# Altium schematic sheet Power-Sheet.SchDoc (part 1 of 2)
size 420 x 297 mm; SheetNumber: 2; SheetTotal: 3
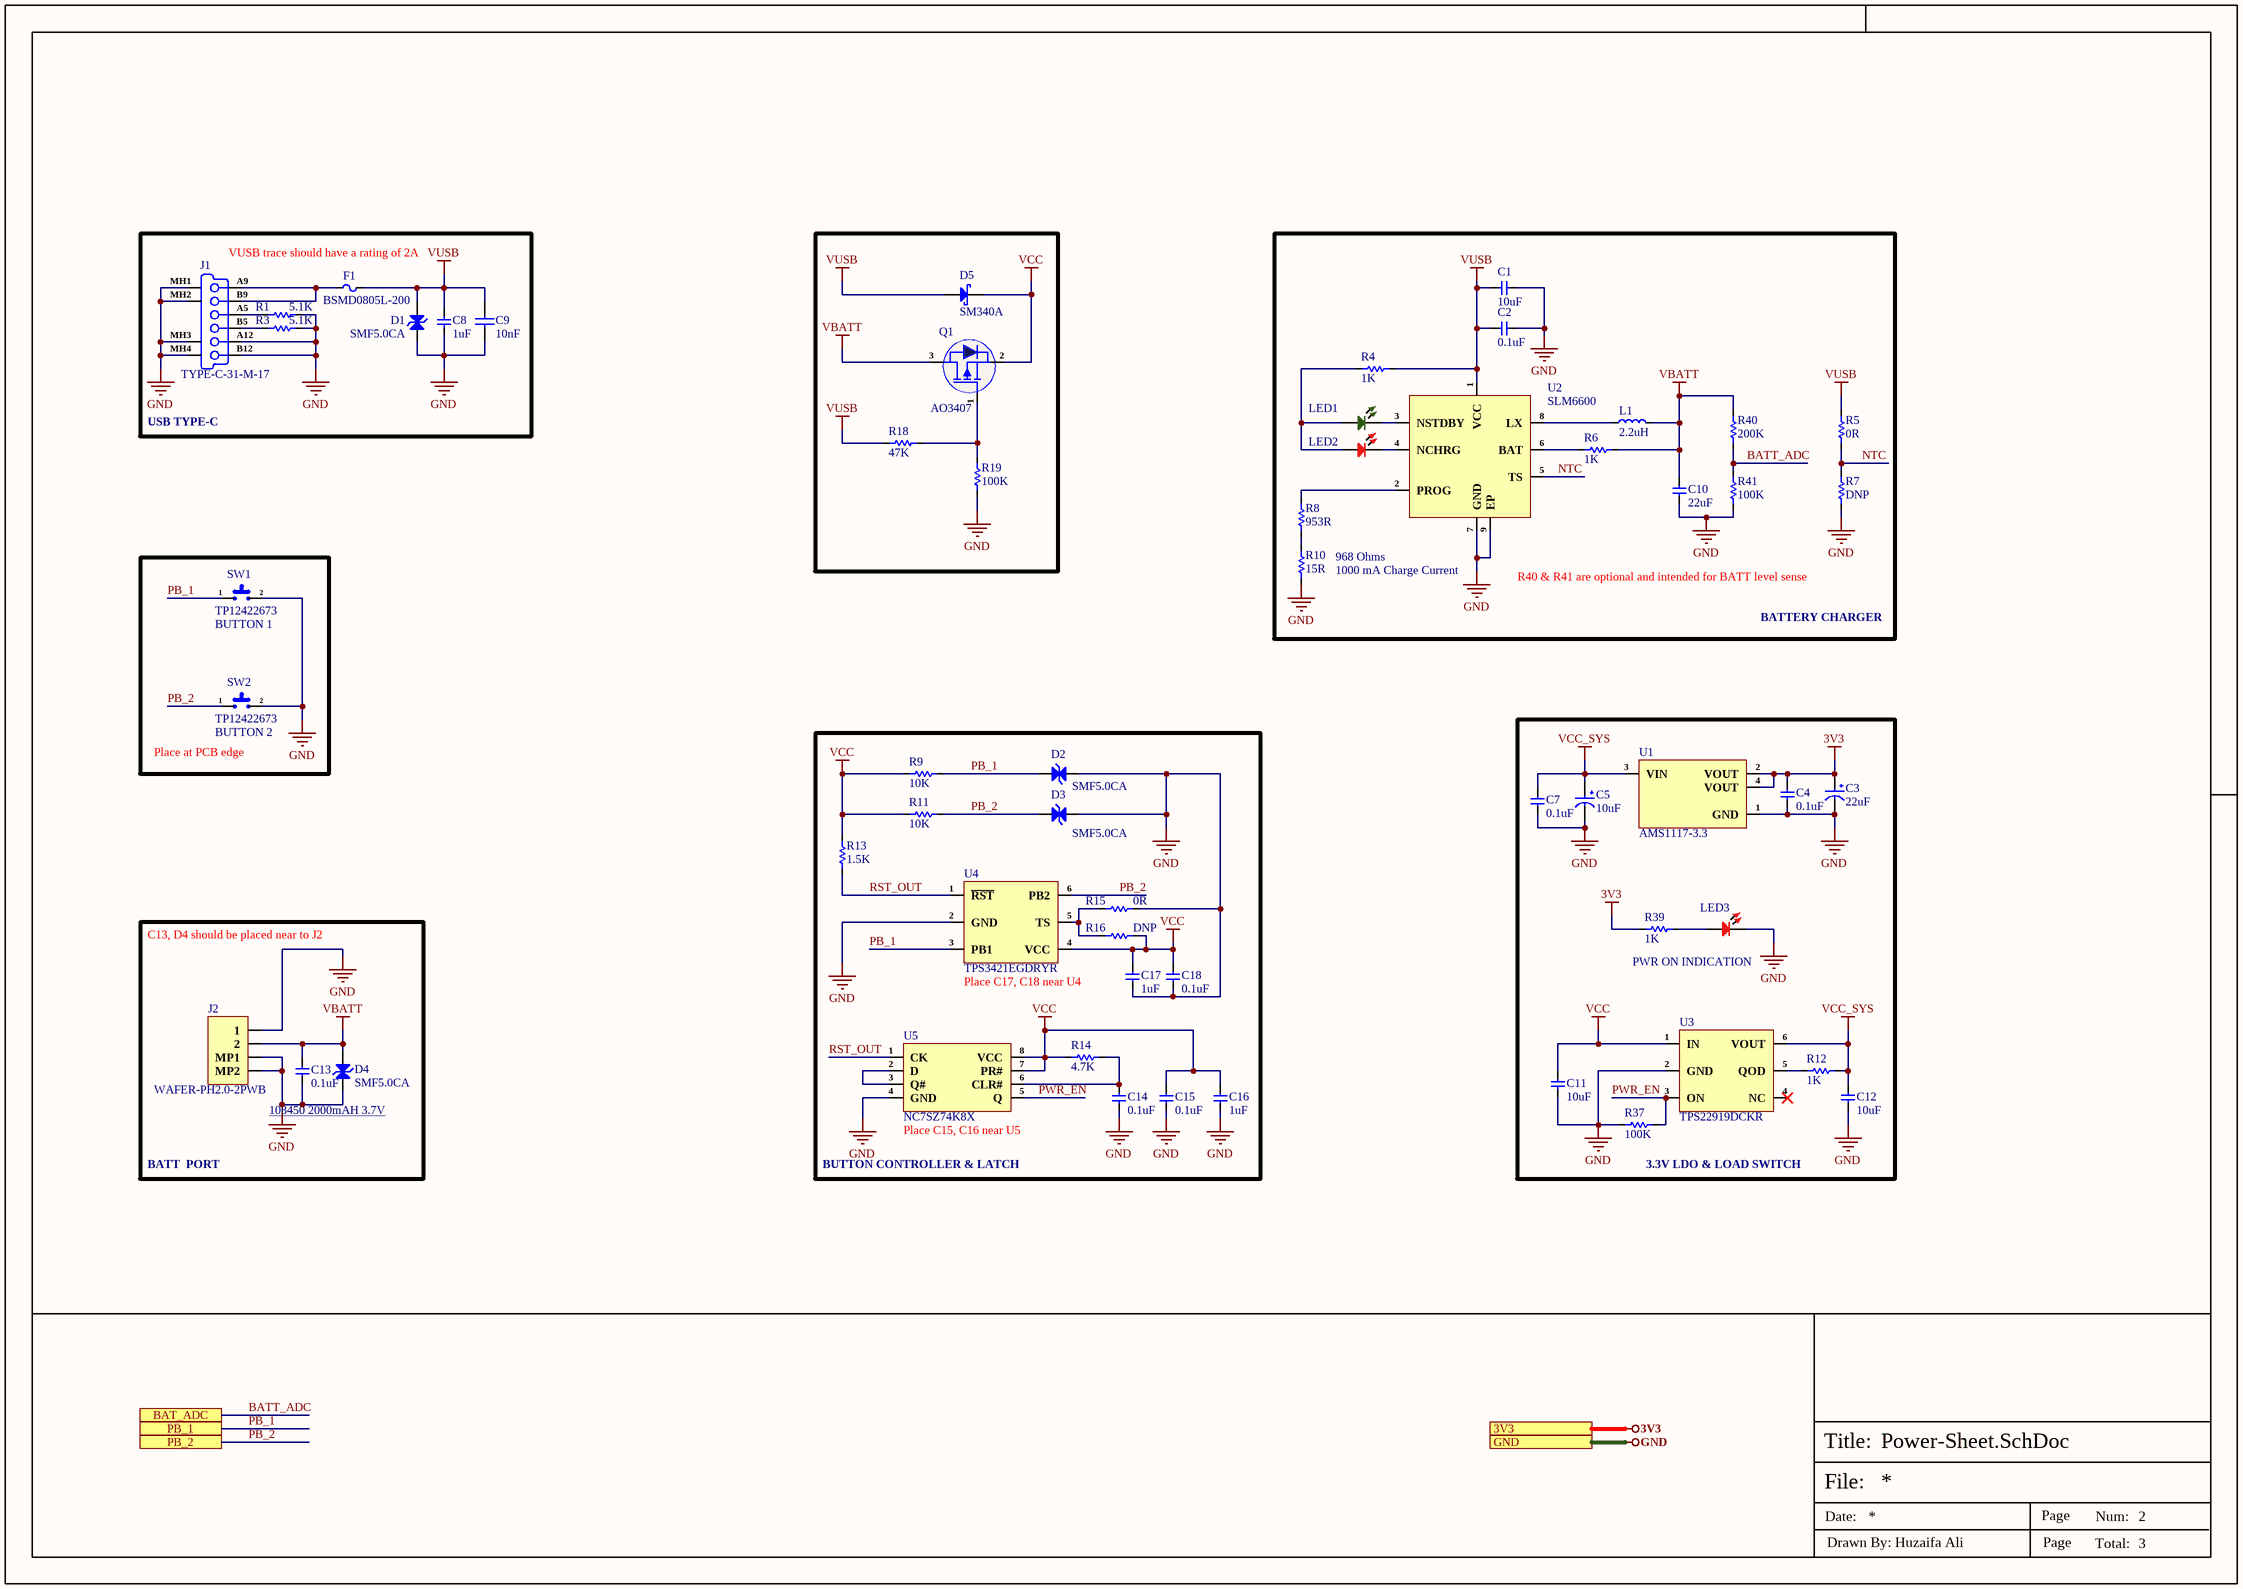
[diagram p0: Power-Sheet.SchDoc]

## Parts
C1  10uF  [Cap-0603]
C2  0.1uF  [Cap-0402]
C3  22uF  [Tant-0805]
C4  0.1uF  [Cap-0402]
C5  10uF  [Tant-0603]
C7  0.1uF  [Cap-0402]
C8  1uF  [Cap-0603]
C9  10nF  [Cap-0603]
C10  22uF  [Cap-0805]
C11  10uF  [Cap-0603]
C12  10uF  [Cap-0603]
C13  0.1uF  [Cap-0402]
C14  0.1uF  [Cap-0402]
C15  0.1uF  [Cap-0402]
C16  1uF  [Cap-0603]
C17  1uF  [Cap-0603]
C18  0.1uF  [Cap-0402]
D1  SMF5.0CA  [SOD-123 (Bi-Directional)]
D2  SMF5.0CA  [SOD-123 (Bi-Directional)]
D3  SMF5.0CA  [SOD-123 (Bi-Directional)]
D4  SMF5.0CA  [SOD-123 (Bi-Directional)]
D5  SM340A  [SMA]
F1  BSMD0805L-200  [Fuse-0805]
J1  TYPE-C-31-M-17  [TYPE-C-31-M-17_]
J2  WAFER-PH2.0-2PWB  [WAFER-PH2.0-2PWB]
L1  2.2uH  [YSPI0520-2R2M_]
LED1  XZVG68W-2  [LED-0402]  (value not drawn)
LED2  Red  [LED-0402]  (value not drawn)
LED3  Red  [LED-0402]  (value not drawn)
Q1  AO3407  [SOT-23]
R1  5.1K  [Res-0603]
R3  5.1K  [Res-0603]
R4  1K  [Res-0402]
R5  0R  [Res-0603]
R6  1K  [RES-0805]
R7  DNP  [Res-0603]
R8  953R  [Res-0603]
R9  10K  [Res-0402]
R10  15R  [Res-0603]
R11  10K  [Res-0402]
R12  1K  [Res-0603]
R13  1.5K  [Res-0402]
R14  4.7K  [Res-0402]
R15  0R  [Res-0603]
R16  DNP  [Res-0603]
R18  47K  [Res-0402]
R19  100K  [Res-0402]
R37  100K  [Res-0402]
R39  1K  [Res-0402]
R40  200K  [Res-0402]
R41  100K  [Res-0402]
SW1  TP12422673  [TP12422673]
SW2  TP12422673  [TP12422673]
U1  AMS1117-3.3  [SOT- 223]
U2  SLM6600  [8-SO-EP_]
U3  TPS22919DCKR  [SC-70-6]
U4  TPS3421EGDRYR  [6-SON (1.45x1)]
U5  NC7SZ74K8X  [VFSOP-8-2.3mm]

## Ports
3V3 (see Top_Sheet[2B], Controller-Sheet[4D]), BAT_ADC (see Top_Sheet[3B], Controller-Sheet[1D]), GND (see Top_Sheet[2B], Controller-Sheet[4D]), PB_1 (see Top_Sheet[3B], Controller-Sheet[1D]), PB_2 (see Top_Sheet[3B], Controller-Sheet[1D])

## Nets
3V3: C3.1 C4.2 R39.1 U1.2(VOUT) U1.4(VOUT) ; port 3V3
GND: C1.1 C2.1 C3.2 C4.1 C5.2 C7.1 C8.1 C9.1 C10.1 C11.2 C12.2 C13.1 C14.1 C15.1 C16.1 C17.1 C18.1 D1.1(A) D2.1(A) D3.1(A) D4.1(A) J1.A12(GND) J1.B12(GND) J1.MH1(Tab) J1.MH2(Tab) J1.MH3(Tab) J1.MH4(Tab) J2.1 J2.MP1 J2.MP2 LED3.2 R1.2 R3.2 R7.1 R10.1 R15.2 R19.1 R37.1 R41.2 SW1.2 SW2.2 U1.1(GND) U2.7(GND) U2.9(EP) U3.2(GND) U4.2(GND) U5.4(GND) ; port GND
VBATT: C10.2 C13.2 D4.2(K) J2.2 L1.2 Q1.3(D) R6.2 R40.2
VCC: C11.1 C15.2 C16.2 C17.2 C18.2 D5.1(K) Q1.2(S) R9.2 R11.2 R13.2 R14.1 R16.2 U3.1(IN) U4.4(VCC) U5.7(PR#) U5.8(VCC)
VCC_SYS: C5.1 C7.2 C12.1 R12.2 U1.3(VIN) U3.6(VOUT)
VUSB: C1.2 C2.2 C8.2 C9.2 D1.2(K) D5.2(A) F1.2 R4.2 R5.2 R18.1 U2.1(VCC)
BATT_ADC: R40.1 R41.1 ; port BAT_ADC
NTC: R5.1 R7.2 U2.5(TS)
PB_1: D2.2(K) R9.1 SW1.1 U4.3(PB1) ; port PB_1
PB_2: D3.2(K) R11.1 SW2.1 U4.6(PB2) ; port PB_2
PWR_EN: R37.2 U3.3(ON) U5.5(Q)
RST_OUT: R13.1 U4.1(~{RST}) U5.1(CK)
NetC14_2: C14.2 R14.2 U5.6(CLR#)
NetF1_1: F1.1 J1.A9(VBUS) J1.B9(VBUS)
NetJ1_A5: J1.A5(CC1) R1.1
NetJ1_B5: J1.B5(CC2) R3.1
NetL1_1: L1.1 U2.8(LX)
NetLED1_1: LED1.1 LED2.1 R4.1
NetLED1_2: LED1.2 U2.3(NSTDBY)
NetLED2_2: LED2.2 U2.4(NCHRG)
NetLED3_1: LED3.1 R39.2
NetQ1_1: Q1.1(G) R18.2 R19.2
NetR6_1: R6.1 U2.6(BAT)
NetR8_1: R8.1 R10.2
NetR8_2: R8.2 U2.2(PROG)
NetR12_1: R12.1 U3.5(QOD)
NetR15_1: R15.1 R16.1 U4.5(TS)
NetU5_2: U5.2(D) U5.3(Q#)

Not connected (* = marked no-connect by the designer): U3 4(NC)*

## Notes on the sheet
- VUSB trace should have a rating of 2A
- USB TYPE-C
- 968 Ohms
- 1000 mA Charge Current
- R40 & R41 are optional and intended for BATT level sense
- (near SW1) BUTTON 1
- BATTERY CHARGER
- (near SW2) Place at PCB edge
- (near SW2) BUTTON 2
- C13, D4 should be placed near to J2
- Place C17, C18 near U4
- PWR ON INDICATION
- 103450 2000mAH 3.7V <https://www.aliexpress.us/item/3256807956783673.html?spm=a2g0o.detail.pcDetailTopMoreOtherSeller.7.c89ceBe2eBe2yp&gps-id=pcDetailTopMoreOtherSeller&scm=1007.40196.417130.0&scm_id=1007.40196.417130.0&scm-url=1007.40196.417130.0&pvid=267ca87e-568d-4cf5-8ec2-89fa39d64639&_t=gps-id%3ApcDetailTopMoreOtherSeller%2Cscm-url%3A1007.40196.417130.0%2Cpvid%3A267ca87e-568d-4cf5-8ec2-89fa39d64639%2Ctpp_buckets%3A668%232846%238112%231997&pdp_npi=4%40dis%21USD%2111.34%216.81%21%21%2182.38%2149.43%21%4021015b2417350288432825182e91ba%2112000043969771197%21rec%21US%21%21ABXZ&utparam-url=scene%3ApcDetailTopMoreOtherSeller%7Cquery_from%3A&gatewayAdapt=glo2usa>
- (near U5) Place C15, C16 near U5
- BATT  PORT
- BUTTON CONTROLLER & LATCH
- (near R37) 3.3V LDO & LOAD SWITCH
- File:
- Title:
- Date:
- Page
- Num:
- Total:
- Drawn By: Huzaifa Ali